# Altium schematic sheet LattePanda_Mu.SchDoc
size B; Organization: Altium Limited; Address1: L3, 12a Rodborough Rd; Address2: Frenchs Forest; Address3: NSW; Address4: Australia 2086
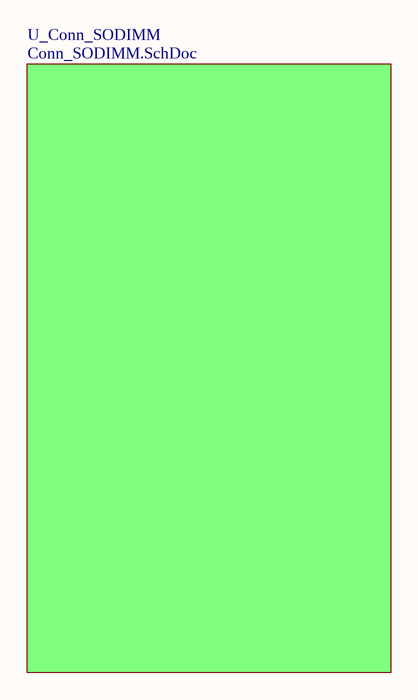
[diagram p0: LattePanda_Mu.SchDoc]

## Sub-sheets
U_Conn_SODIMM = Conn_SODIMM.SchDoc: no entries

## Notes on the sheet
- Title
- Size:
- Date:
- B
- Number:
- Time:
- Revision:
- Sheet
- of
- File: